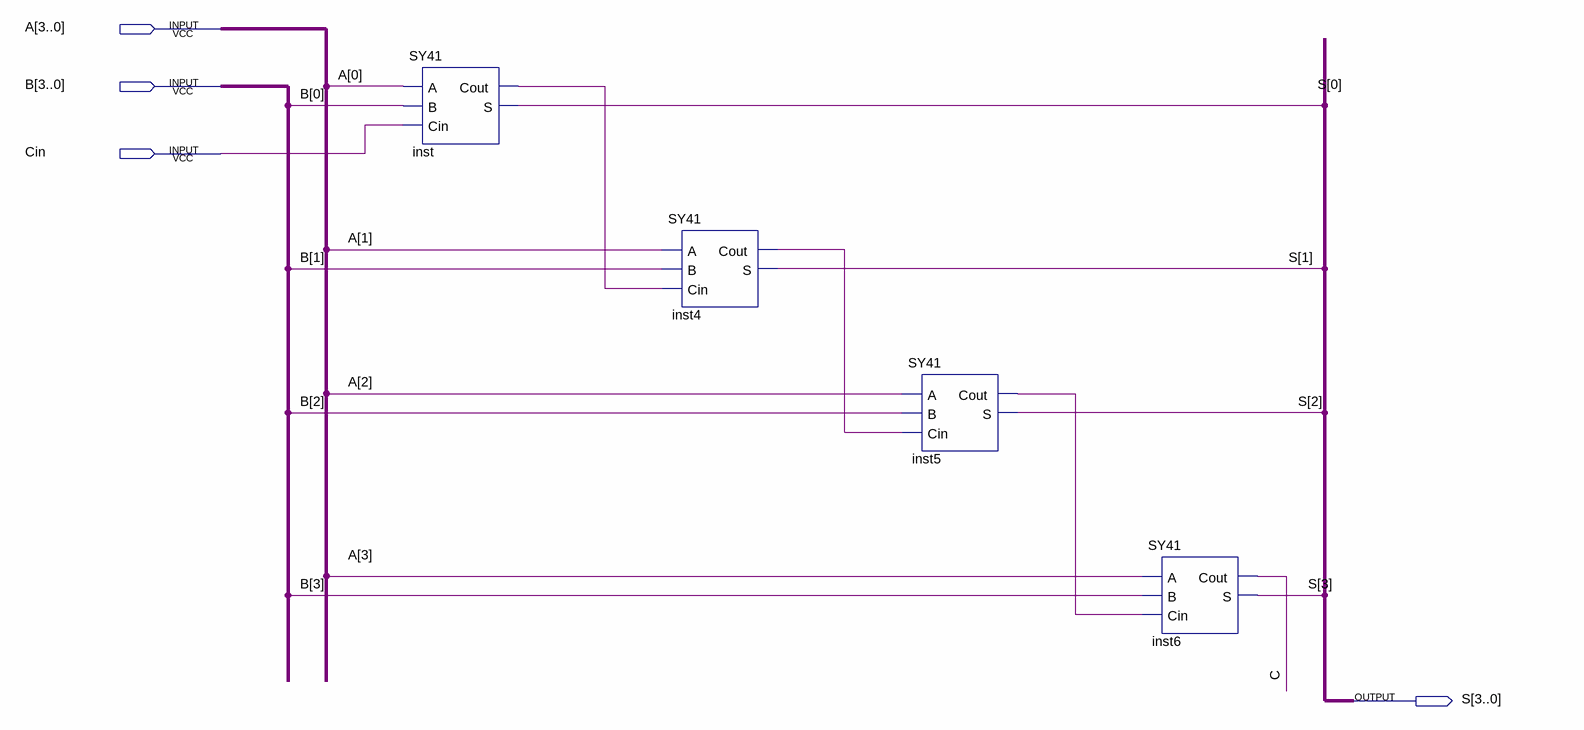
[diagram p0: schematic sheet]
// Quartus schematic Additionneur4bits.bdf as structural Verilog: 4 symbols, 4 pins
module Additionneur4bits (
  input  [3:0] A,
  input  [3:0] B,
  input  Cin,
  output [3:0] S
);

  wire C, inst4_cout, inst5_cout, inst_cout;

  SY41 inst (.A(A[0]), .B(B[0]), .Cin(Cin), .Cout(inst_cout), .S(S[0]));
  SY41 inst4 (.A(A[1]), .B(B[1]), .Cin(inst_cout), .Cout(inst4_cout), .S(S[1]));
  SY41 inst5 (.A(A[2]), .B(B[2]), .Cin(inst4_cout), .Cout(inst5_cout), .S(S[2]));
  SY41 inst6 (.A(A[3]), .B(B[3]), .Cin(inst5_cout), .Cout(C), .S(S[3]));
endmodule
